# Altium schematic sheet SYS.SchDoc
size A4; SheetNumber: 1; SheetTotal: 1
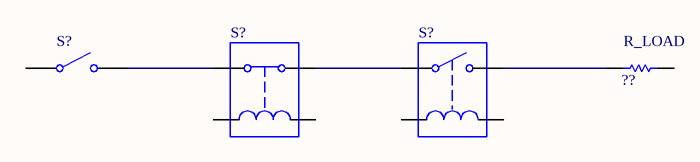
[diagram p0: SYS.SchDoc]

## Parts
(Parts that share a designator on the sheet are numbered #1, #2 ... from top to bottom, then left to right.)
R_LOAD  value ??  (hidden comment: Resistor)
S?#1  Single-Pole, Single-Throw Switch  (value not drawn)
S?#2  Single-Pole, Single-Throw Normally Closed Relay  (value not drawn)
S?#3  Single-Pole, Single-Throw Normally Opened Relay  (value not drawn)

## Nets
NetR_LOAD_1: R_LOAD.1 S?#3.2
NetS?#1_2: S?#1.2 S?#2.1
NetS?#2_2: S?#2.2 S?#3.1

Not connected (* = marked no-connect by the designer): R_LOAD 2; S?#1 1; S?#2 3 4; S?#3 3 4

## Library data of the parts
R_LOAD = Resistor: TC1: 0; SimulationGenericComponent: True; TC2: 0
S?#1 = SPST SW: closed: 0; Rclosed: 1m; Ropen: 1Meg; SimulationGenericComponent: True
S?#2 = SPST Relay NC: L_C: 1u; R_C: 100; RON: 1; ROFF: 1e12; ION: 1m; IOFF: 0; SimulationGenericComponent: True
S?#3 = SPST Relay NO: L_C: 1u; R_C: 100; RON: 1; ROFF: 1e12; ION: 1m; IOFF: 0; SimulationGenericComponent: True